# Altium schematic sheet STPMotorControl_1.SchDoc
size A4; SheetNumber: 2; SheetTotal: 6
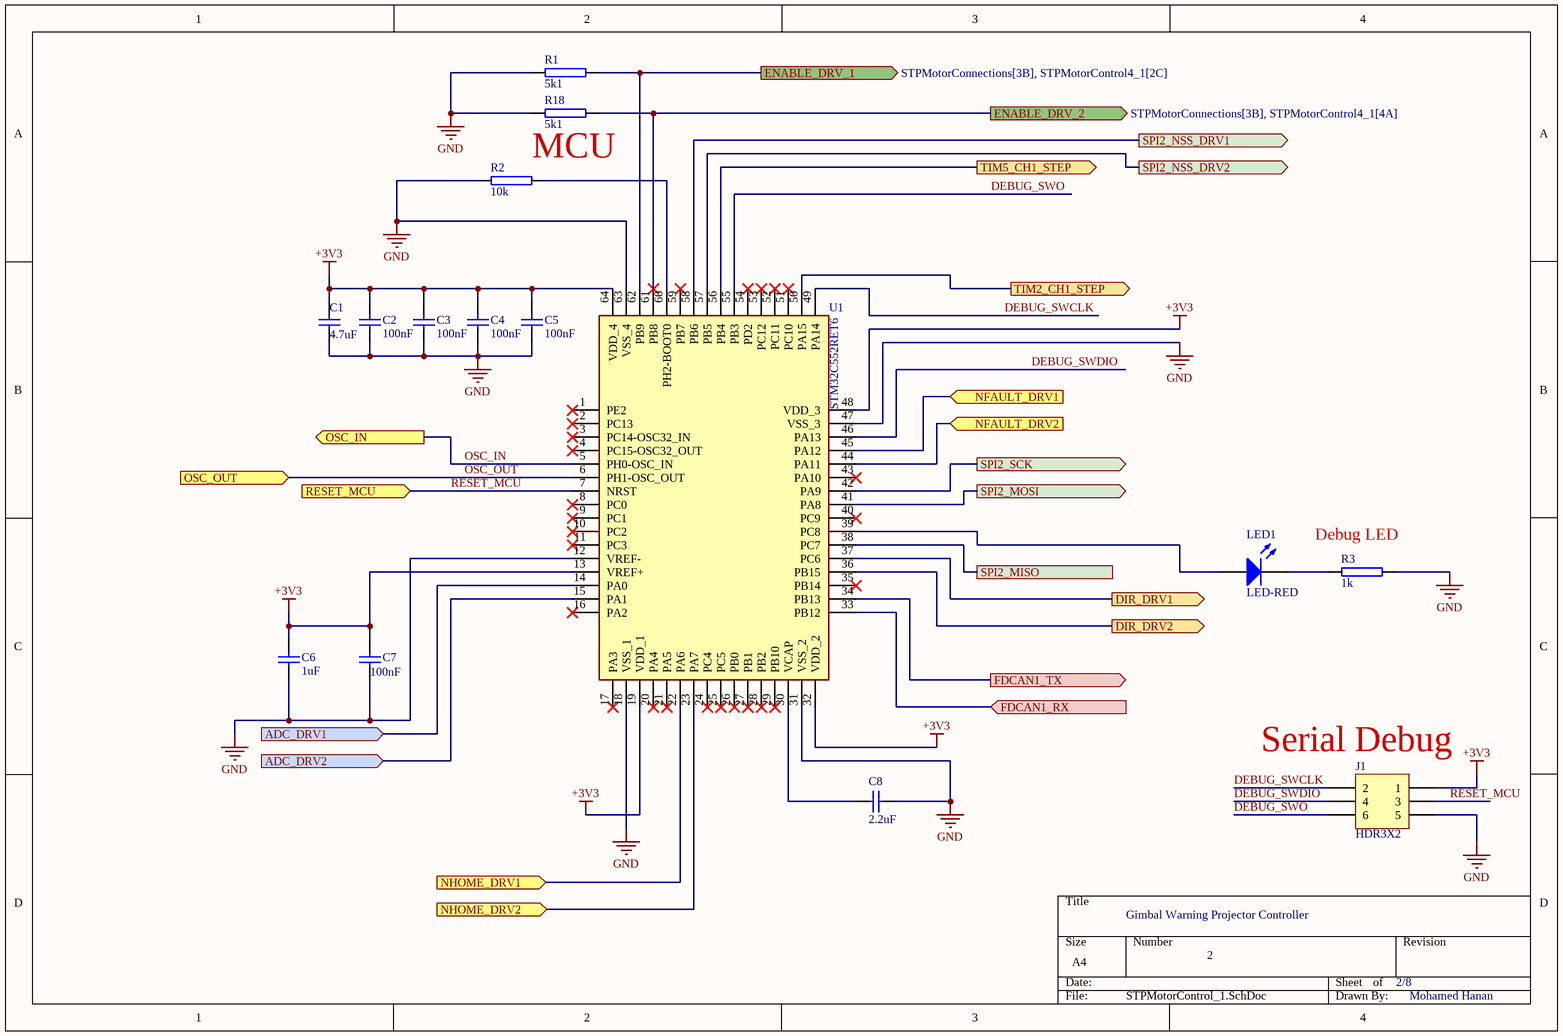
[diagram p0: STPMotorControl_1.SchDoc]

## Parts
C1  4.7uF  [CAP_1206]
C2  100nF  [CAP_0805]
C3  100nF  [CAP_0805]
C4  100nF  [CAP_0805]
C5  100nF  [CAP_0805]
C6  1uF  [CAP_0805]
C7  100nF  [CAP_0805]
C8  2.2uF  [CAP_0805]
J1  HDR3X2  [HDR2X3_AUT]
LED1  LED-RED  [LED1206R]
R1  5k1  [RES_0805]
R2  10k  [RES_0805]
R3  1k  [RES_1206]
R18  5k1  [RES_0805]
U1  STM32C552RET6  [LQFP40P900X900X145-64N]

## Ports
ADC_DRV1 (in, see STPMotorConnections[2A], STPMotorControl7_1[2B]), ADC_DRV2 (in, see STPMotorConnections[2A], STPMotorControl7_1[2A]), DIR_DRV1 (out, see STPMotorConnections[2C], STPMotorControl4_1[2C]), DIR_DRV2 (out, see STPMotorConnections[2C], STPMotorControl4_1[4A]), ENABLE_DRV_1 (out, see STPMotorConnections[3B], STPMotorControl4_1[2C]), ENABLE_DRV_2 (out, see STPMotorConnections[3B], STPMotorControl4_1[4A]), FDCAN1_RX (in, see STPMotorConnections[3B], STPMotorControl2_1[1B]), FDCAN1_TX (out, see STPMotorConnections[3B], STPMotorControl2_1[1B]), NFAULT_DRV1 (in, see STPMotorConnections[2C], STPMotorControl4_1[2D]), NFAULT_DRV2 (in, see STPMotorConnections[2C], STPMotorControl4_1[4B]), NHOME_DRV1 (in, see STPMotorConnections[3A], STPMotorControl4_1[2C]), NHOME_DRV2 (in, see STPMotorConnections[3A], STPMotorControl4_1[4B]), OSC_IN (out, see STPMotorConnections[3C], STPMotorControl3_1[2C]), OSC_OUT (in, see STPMotorConnections[3C], STPMotorControl3_1[2C]), RESET_MCU (in, see STPMotorConnections[3C], STPMotorControl3_1[3C]), SPI2_MISO (see STPMotorConnections[3B], STPMotorControl4_1[4C]), SPI2_MOSI (out, see STPMotorConnections[3C], STPMotorControl4_1[4C]), SPI2_NSS_DRV1 (out, see STPMotorConnections[2B], STPMotorControl4_1[2C]), SPI2_NSS_DRV2 (out, see STPMotorConnections[2B], STPMotorControl4_1[4B]), SPI2_SCK (out, see STPMotorConnections[3B], STPMotorControl4_1[4C]), TIM2_CH1_STEP (out, see STPMotorConnections[2B], STPMotorControl4_1[3C]), TIM5_CH1_STEP (out, see STPMotorConnections[2B], STPMotorControl4_1[4A])

## Nets
+3V3: C1.2 C2.2 C3.2 C4.2 C5.2 C6.2 C7.2 J1.1 U1.13(VREF+) U1.19(VDD_1) U1.32(VDD_2) U1.48(VDD_3) U1.64(VDD_4)
GND: C1.1 C2.1 C3.1 C4.1 C5.1 C6.1 C7.1 C8.2 J1.5 R1.1 R2.1 R3.2 R18.1 U1.12(VREF-) U1.18(VSS_1) U1.31(VSS_2) U1.47(VSS_3) U1.63(VSS_4)
ADC_DRV1: U1.14(PA0) ; port ADC_DRV1
ADC_DRV2: U1.15(PA1) ; port ADC_DRV2
DEBUG_SWCLK: J1.2 U1.49(PA14)
DEBUG_SWDIO: J1.4 U1.46(PA13)
DEBUG_SWO: J1.6 U1.55(PB3)
DIR_DRV1: U1.37(PC6) ; port DIR_DRV1
DIR_DRV2: U1.36(PB15) ; port DIR_DRV2
ENABLE_DRV_1: R1.2 U1.62(PB9) ; port ENABLE_DRV_1
ENABLE_DRV_2: R18.2 U1.61(PB8) ; port ENABLE_DRV_2
FDCAN1_RX: U1.33(PB12) ; port FDCAN1_RX
FDCAN1_TX: U1.34(PB13) ; port FDCAN1_TX
NFAULT_DRV1: U1.45(PA12) ; port NFAULT_DRV1
NFAULT_DRV2: U1.44(PA11) ; port NFAULT_DRV2
NHOME_DRV1: U1.22(PA6) ; port NHOME_DRV1
NHOME_DRV2: U1.23(PA7) ; port NHOME_DRV2
OSC_IN: U1.5(PH0-OSC_IN) ; port OSC_IN
OSC_OUT: U1.6(PH1-OSC_OUT) ; port OSC_OUT
RESET_MCU: J1.3 U1.7(NRST) ; port RESET_MCU
SPI2_MISO: U1.38(PC7) ; port SPI2_MISO
SPI2_MOSI: U1.41(PA8) ; port SPI2_MOSI
SPI2_NSS_DRV1: U1.58(PB6) ; port SPI2_NSS_DRV1
SPI2_NSS_DRV2: U1.57(PB5) ; port SPI2_NSS_DRV2
SPI2_SCK: U1.42(PA9) ; port SPI2_SCK
TIM2_CH1_STEP: U1.50(PA15) ; port TIM2_CH1_STEP
TIM5_CH1_STEP: U1.56(PB4) ; port TIM5_CH1_STEP
NetC8_1: C8.1 U1.30(VCAP)
NetLED1_A: LED1.A U1.39(PC8)
NetLED1_K: LED1.K R3.1
NetR2_2: R2.2 U1.60(PH2-BOOT0)

Not connected (* = marked no-connect by the designer): U1 1(PE2)* 2(PC13)* 3(PC14-OSC32_IN)* 4(PC15-OSC32_OUT)* 8(PC0)* 9(PC1)* 10(PC2)* 11(PC3)* 16(PA2)* 17(PA3)* 20(PA4)* 21(PA5)* 24(PC4)* 25(PC5)* 26(PB0)* 27(PB1)* 28(PB2)* 29(PB10)* 35(PB14)* 40(PC9)* 43(PA10)* 51(PC10)* 52(PC11)* 53(PC12)* 54(PD2)* 59(PB7)*

## Notes on the sheet
- MCU
- (near R3) Debug LED
- (near J1) Serial Debug
- Gimbal Warning Projector Controller
- 2
- 2/8
- Mohamed Hanan

## Library data of the parts
C1 = CAPN 1206: Non Polarized Capacitor, SMD, 1206
C2-C8 = CAPN 0805: Non Polarized Capacitor, SMD, 0805
J1 = HDR3X2: Header, 3-Pin, Dual row, 2.54mm Pitch, Straight; Supplier 1: Farnell; Supplier Part Number 1: 9733574
LED1 = SMD 1206 LED-RED: RED LED, Case 1206; Supplier 1: Farnell; Supplier Part Number 1: 8530017
R1 R2 R18 = Resistor 0805: Resistor, SMD, 0805
R3 = Resistor 1206: Resistor, SMD, 1206
U1 = STM32C552RET6: Integrated Circuit; Manufacturer_Name: STMicroelectronics; Datasheet Link: https://www.st.com/resource/en/datasheet/stm32c551cc.pdf; Height: 1.6mm; Manufacturer_Part_Number: STM32C552RET6